# EasyEDA Pro project ProPrj_CSDR_2026-11-13.epro, schematic Schematic1, sheets 11 to 14 of 14

## Sheets
11 GPS: Create Date: 2026-10-03; Page Name: P1; Update Date: 2026-10-03
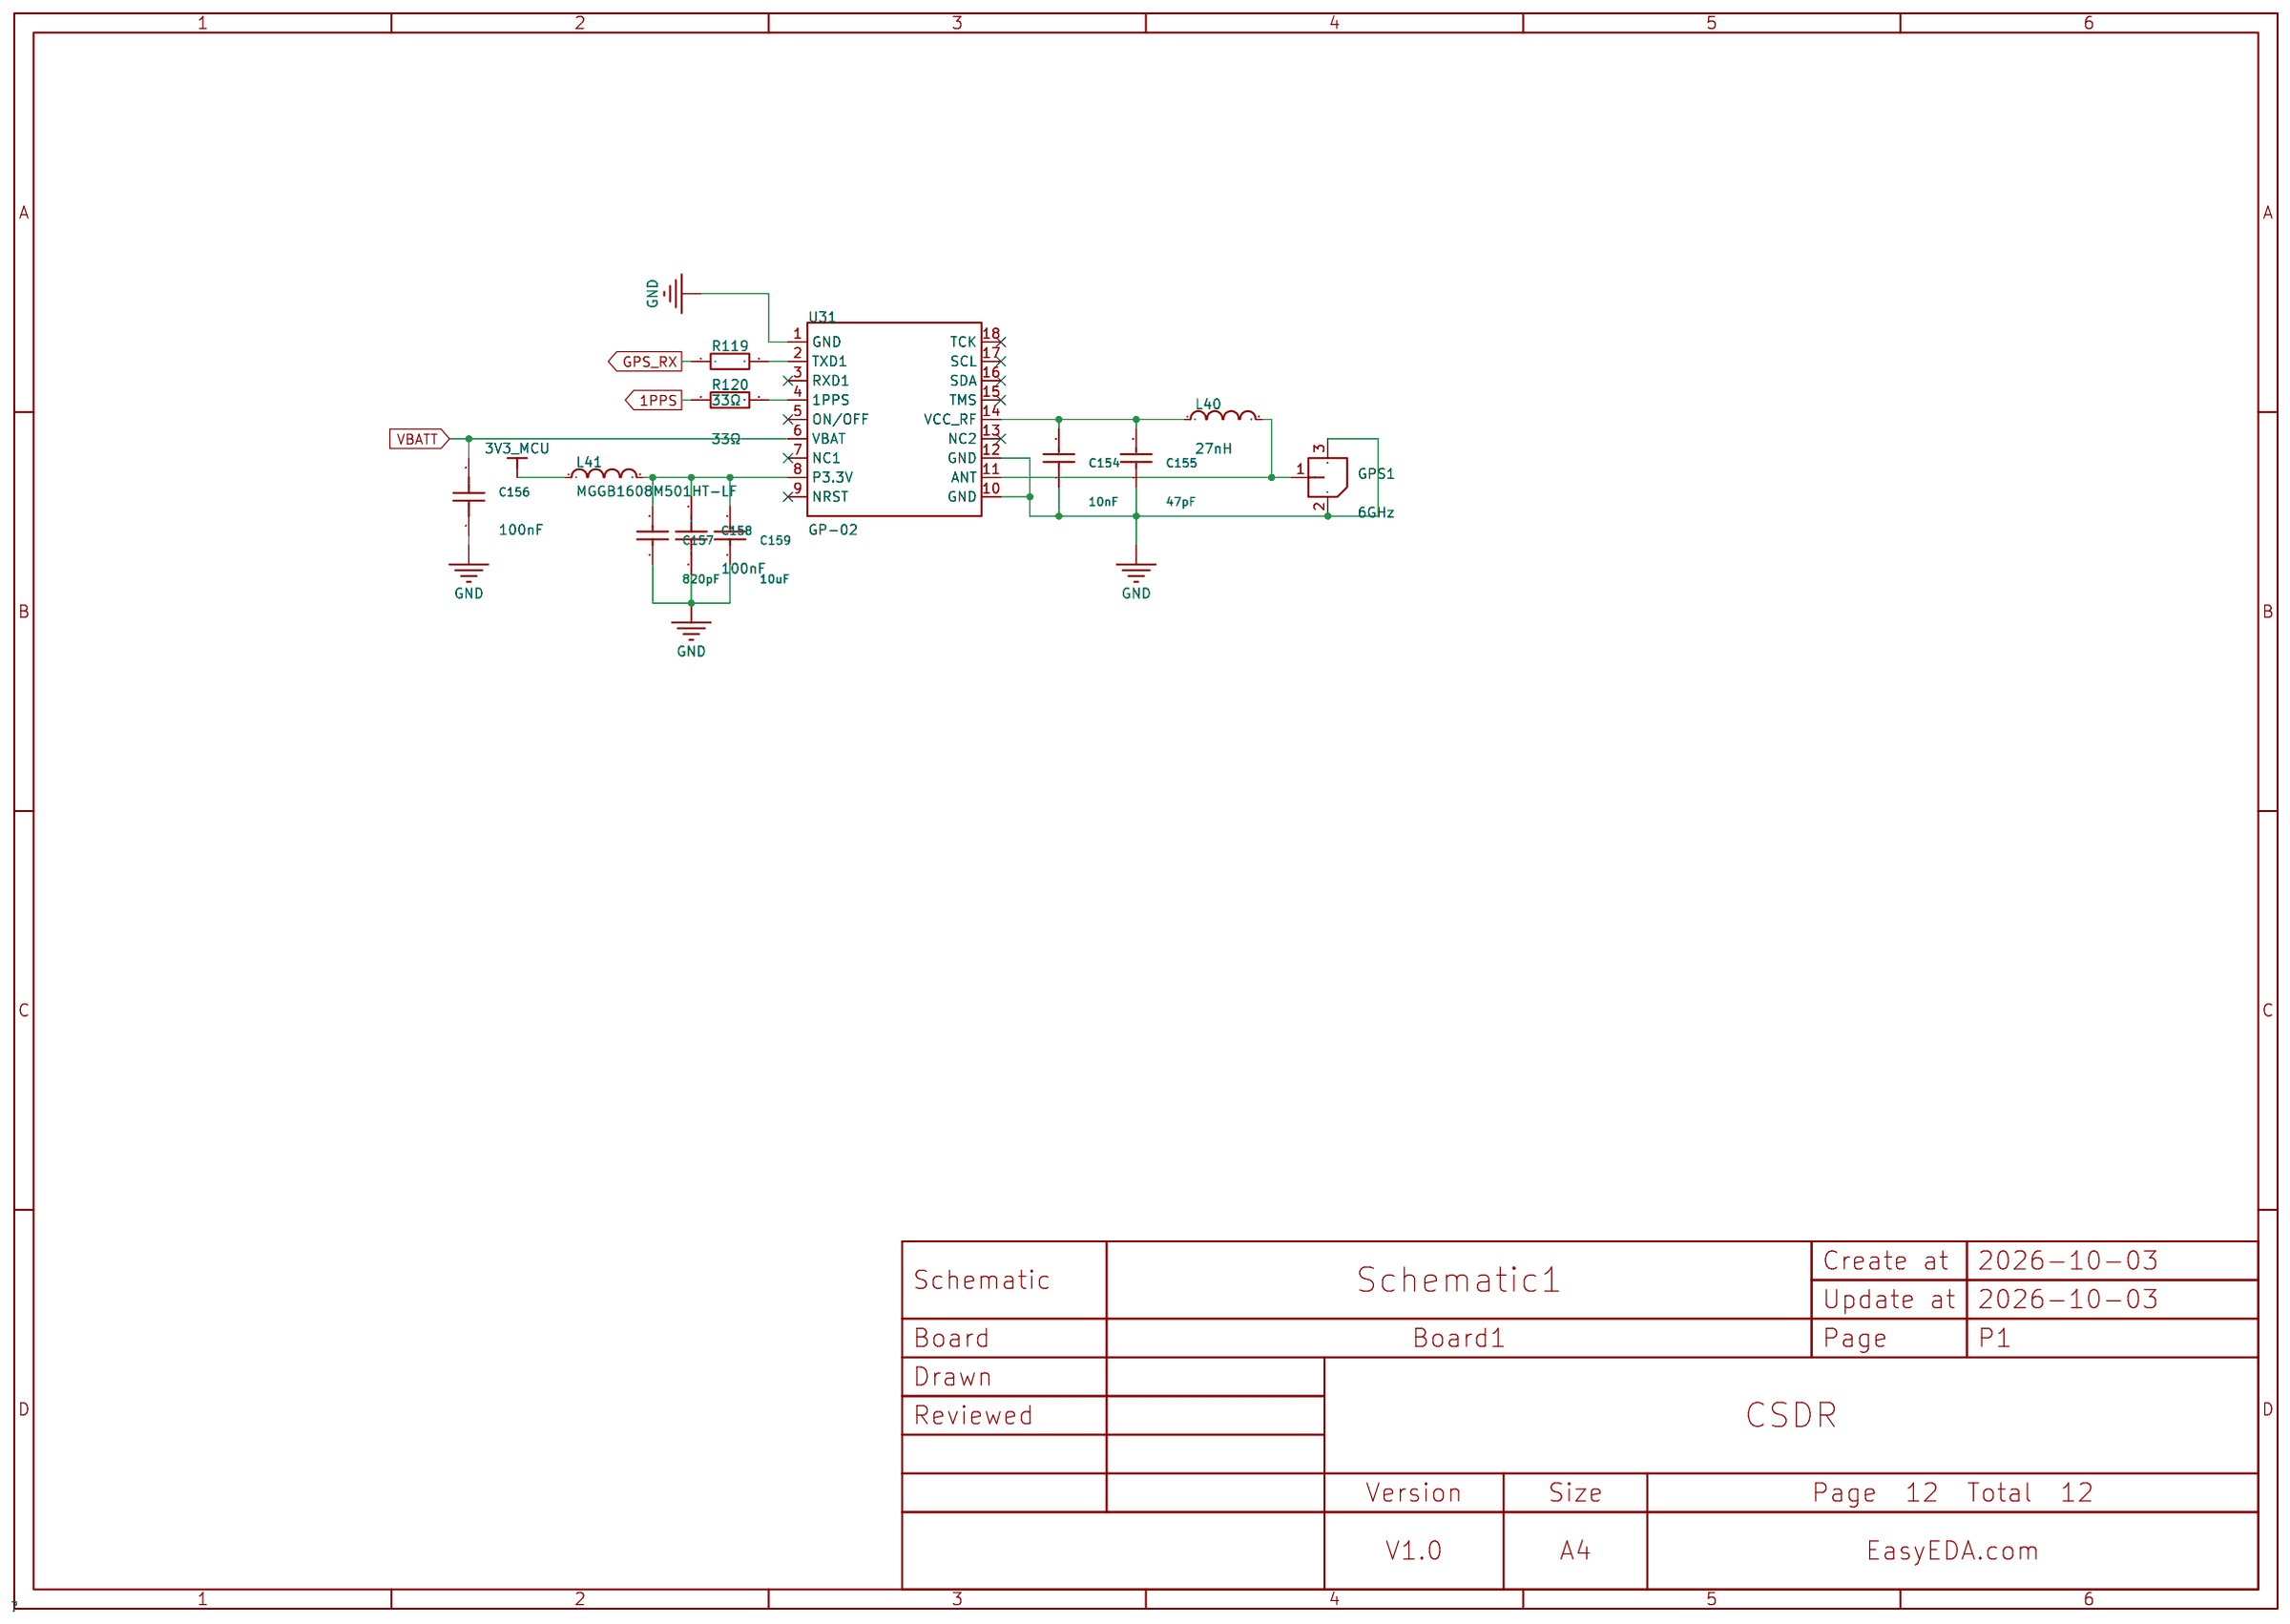
[diagram p12: GPS]
12 POWER: Create Date: 2026-10-03; Page Name: P1; Update Date: 2026-10-03
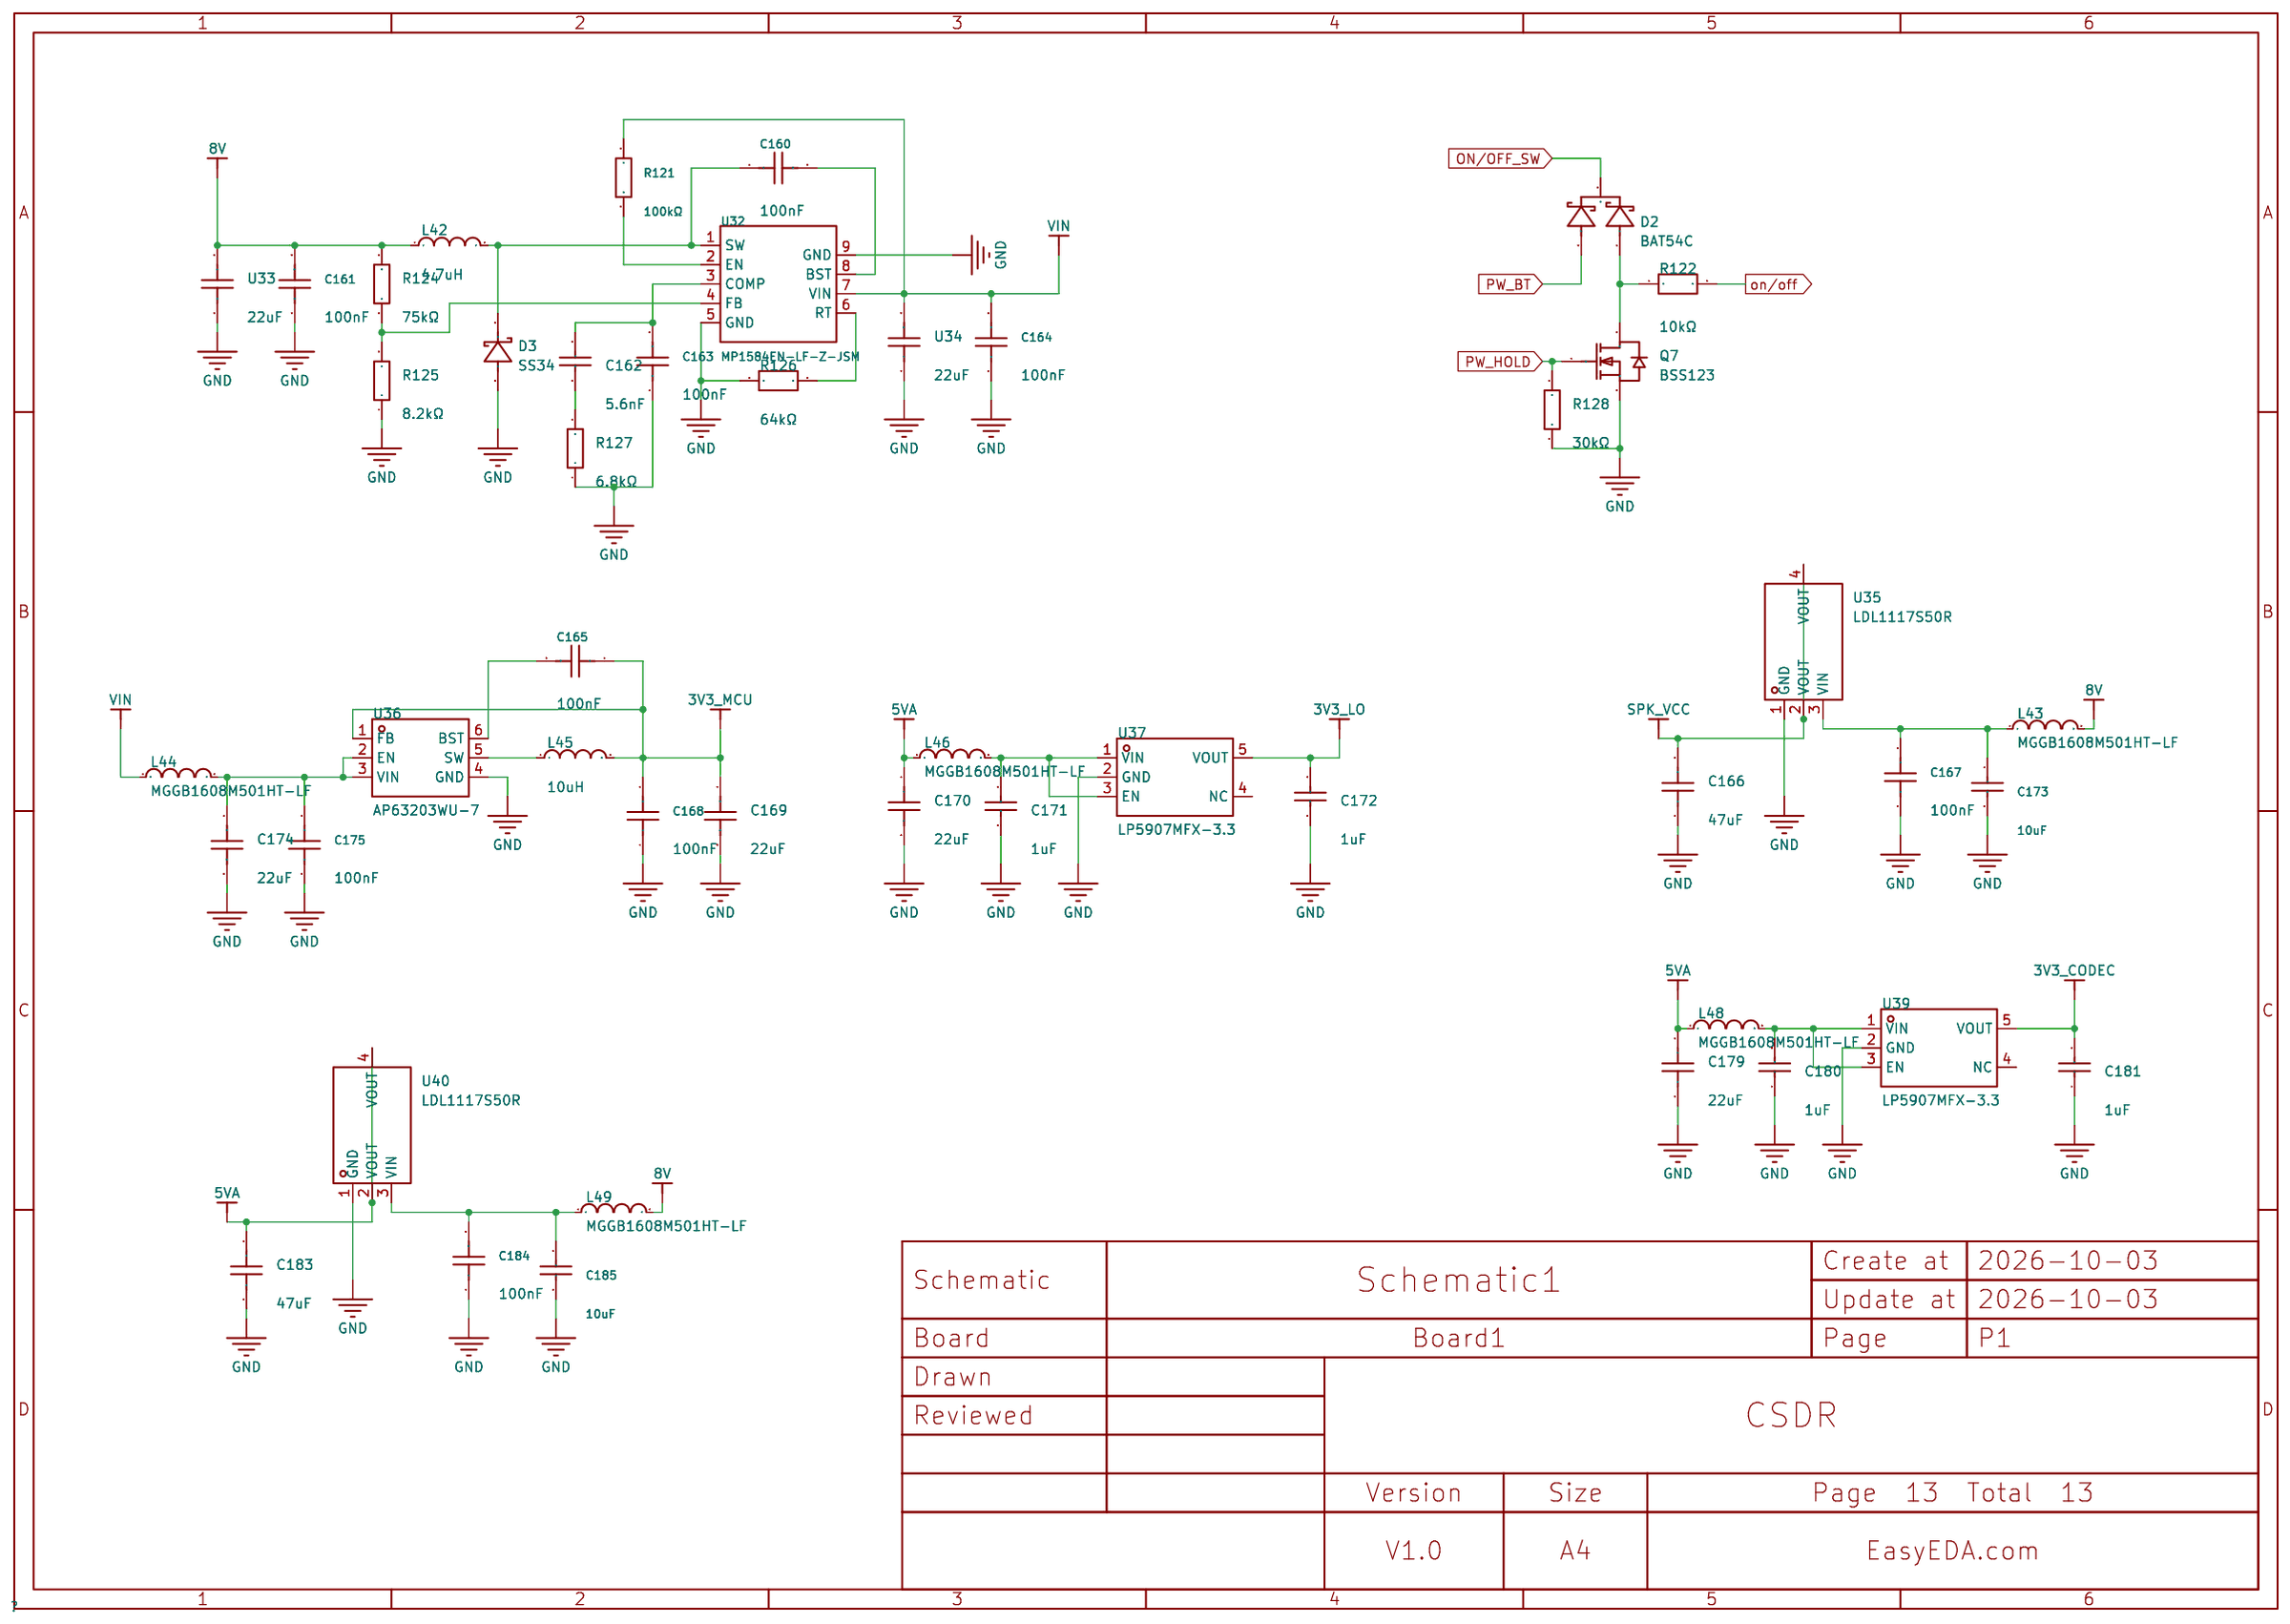
[diagram p13: POWER]
13 CONNECTOR: Create Date: 2026-10-05; Page Name: P1; Update Date: 2026-10-05
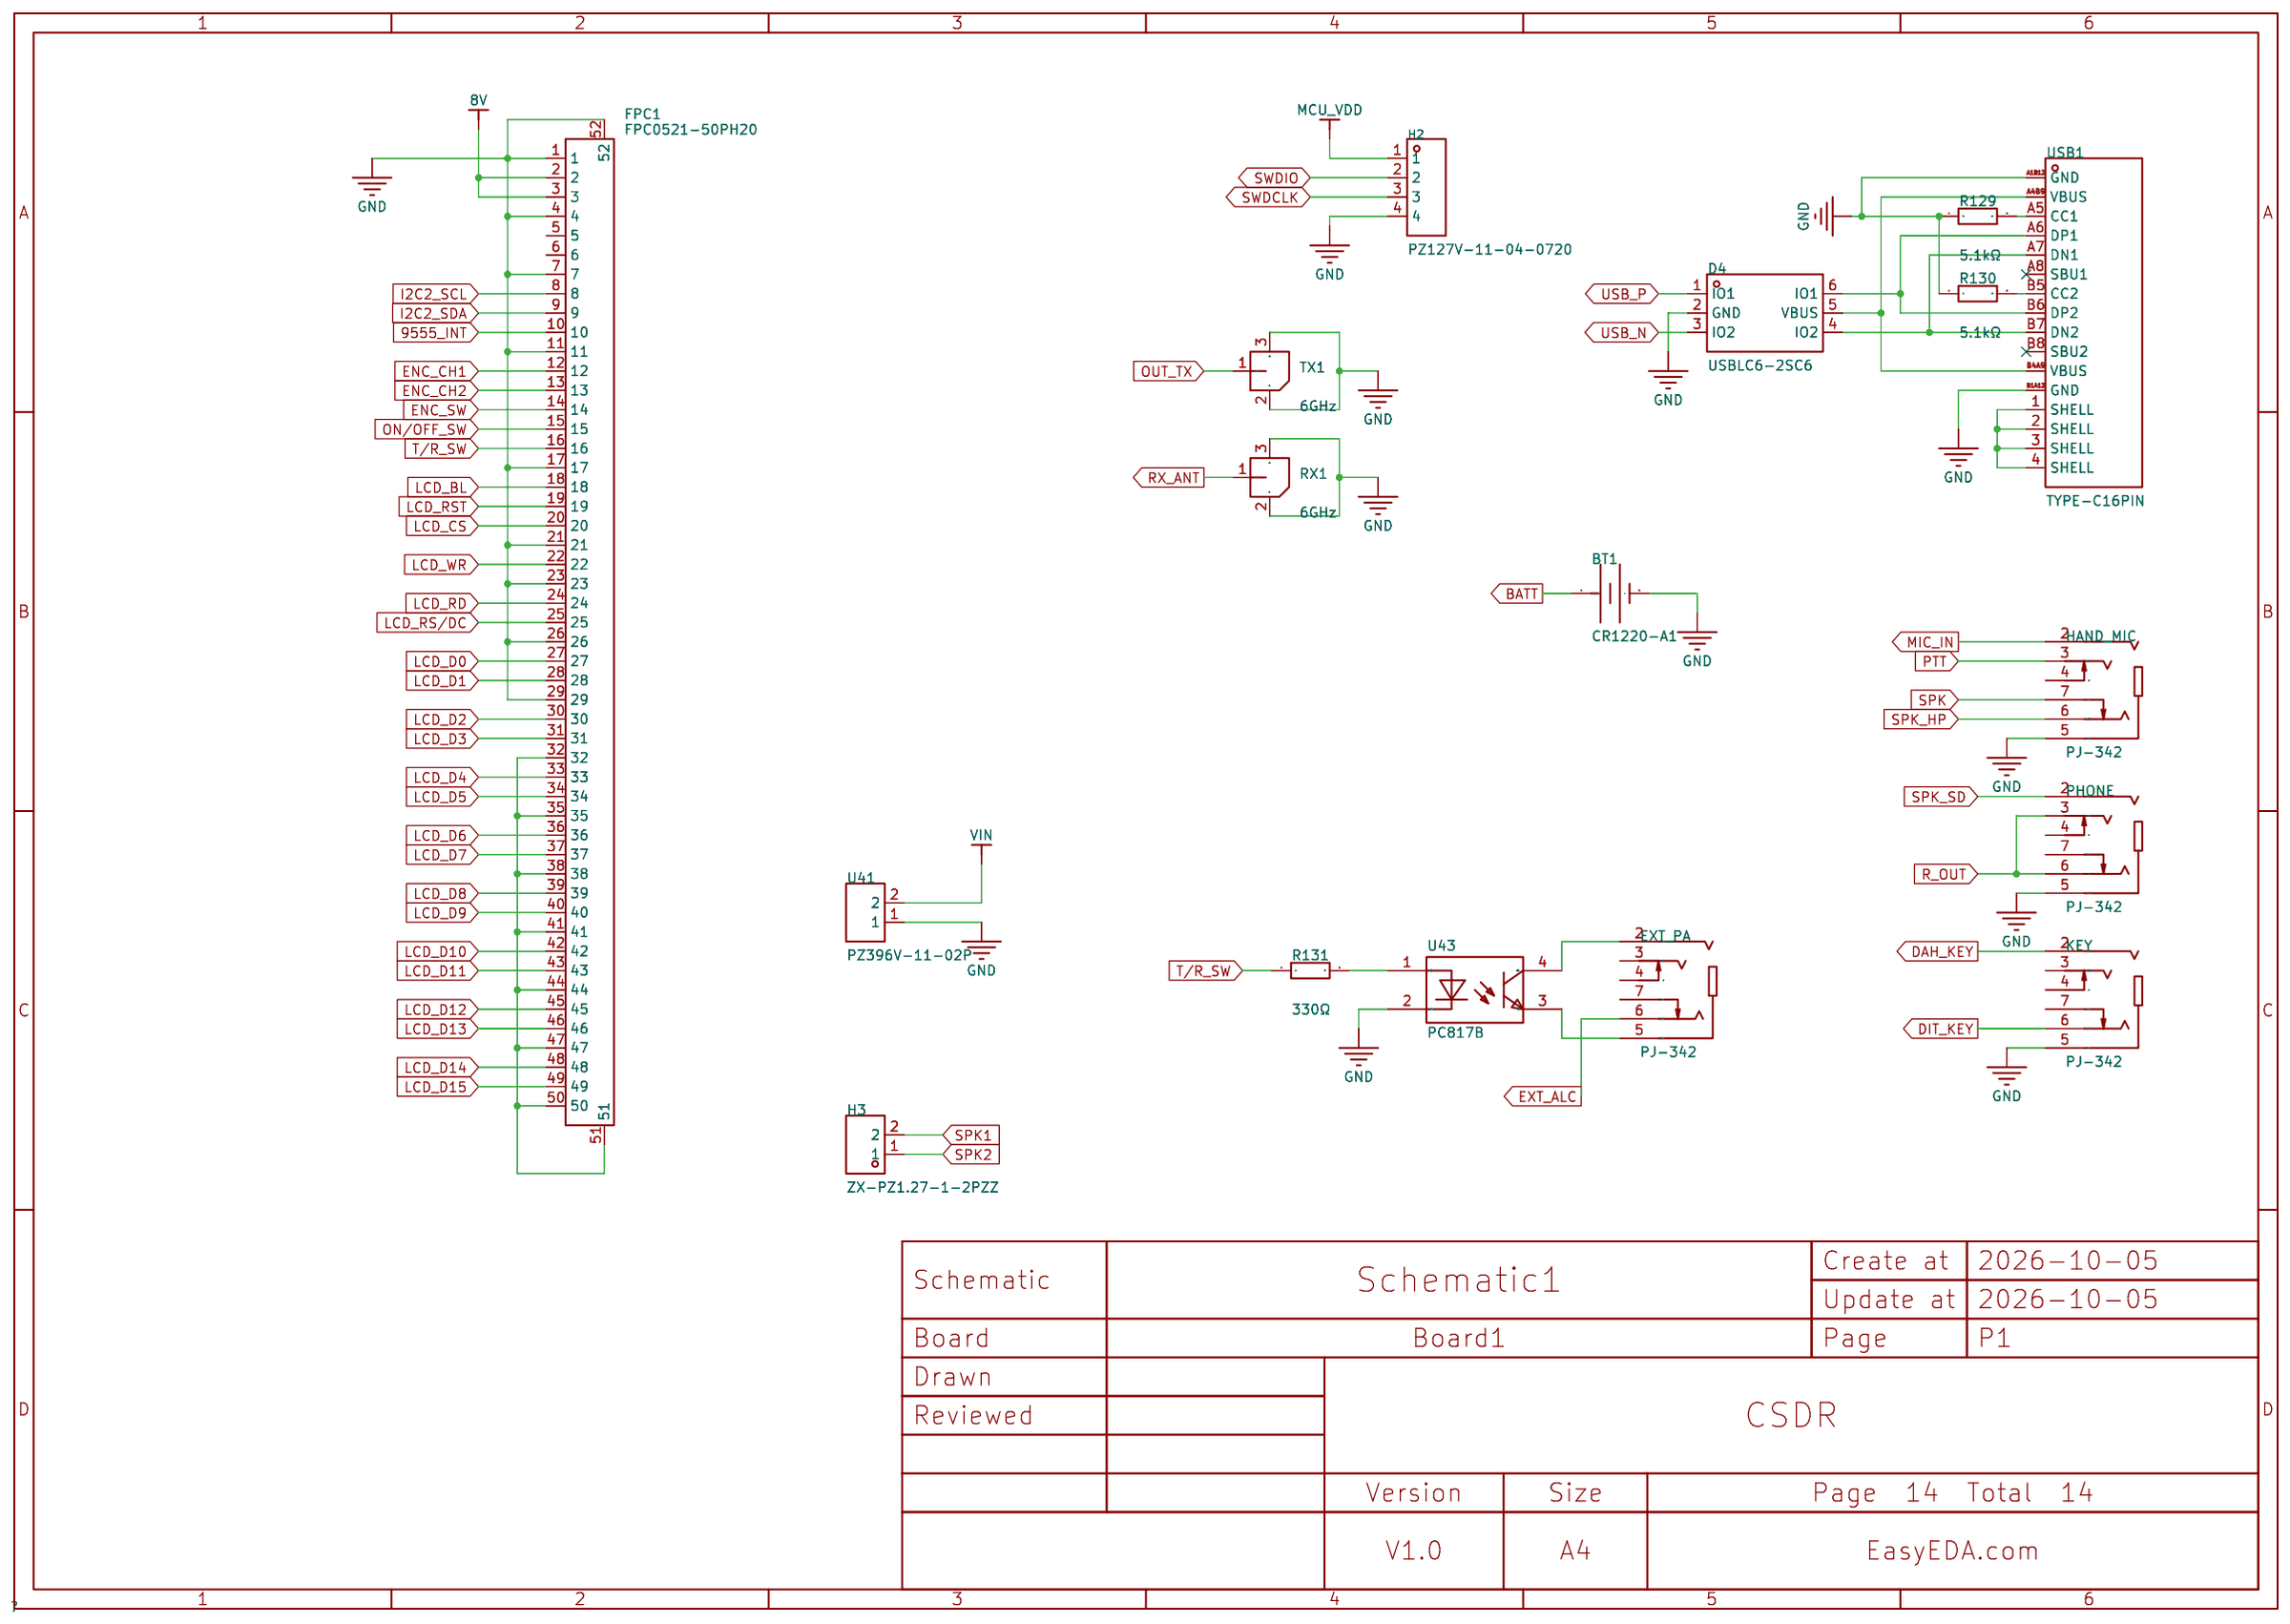
[diagram p14: CONNECTOR]
14 EXT_ALC: Create Date: 2026-11-13; Page Name: P1; Update Date: 2026-11-13
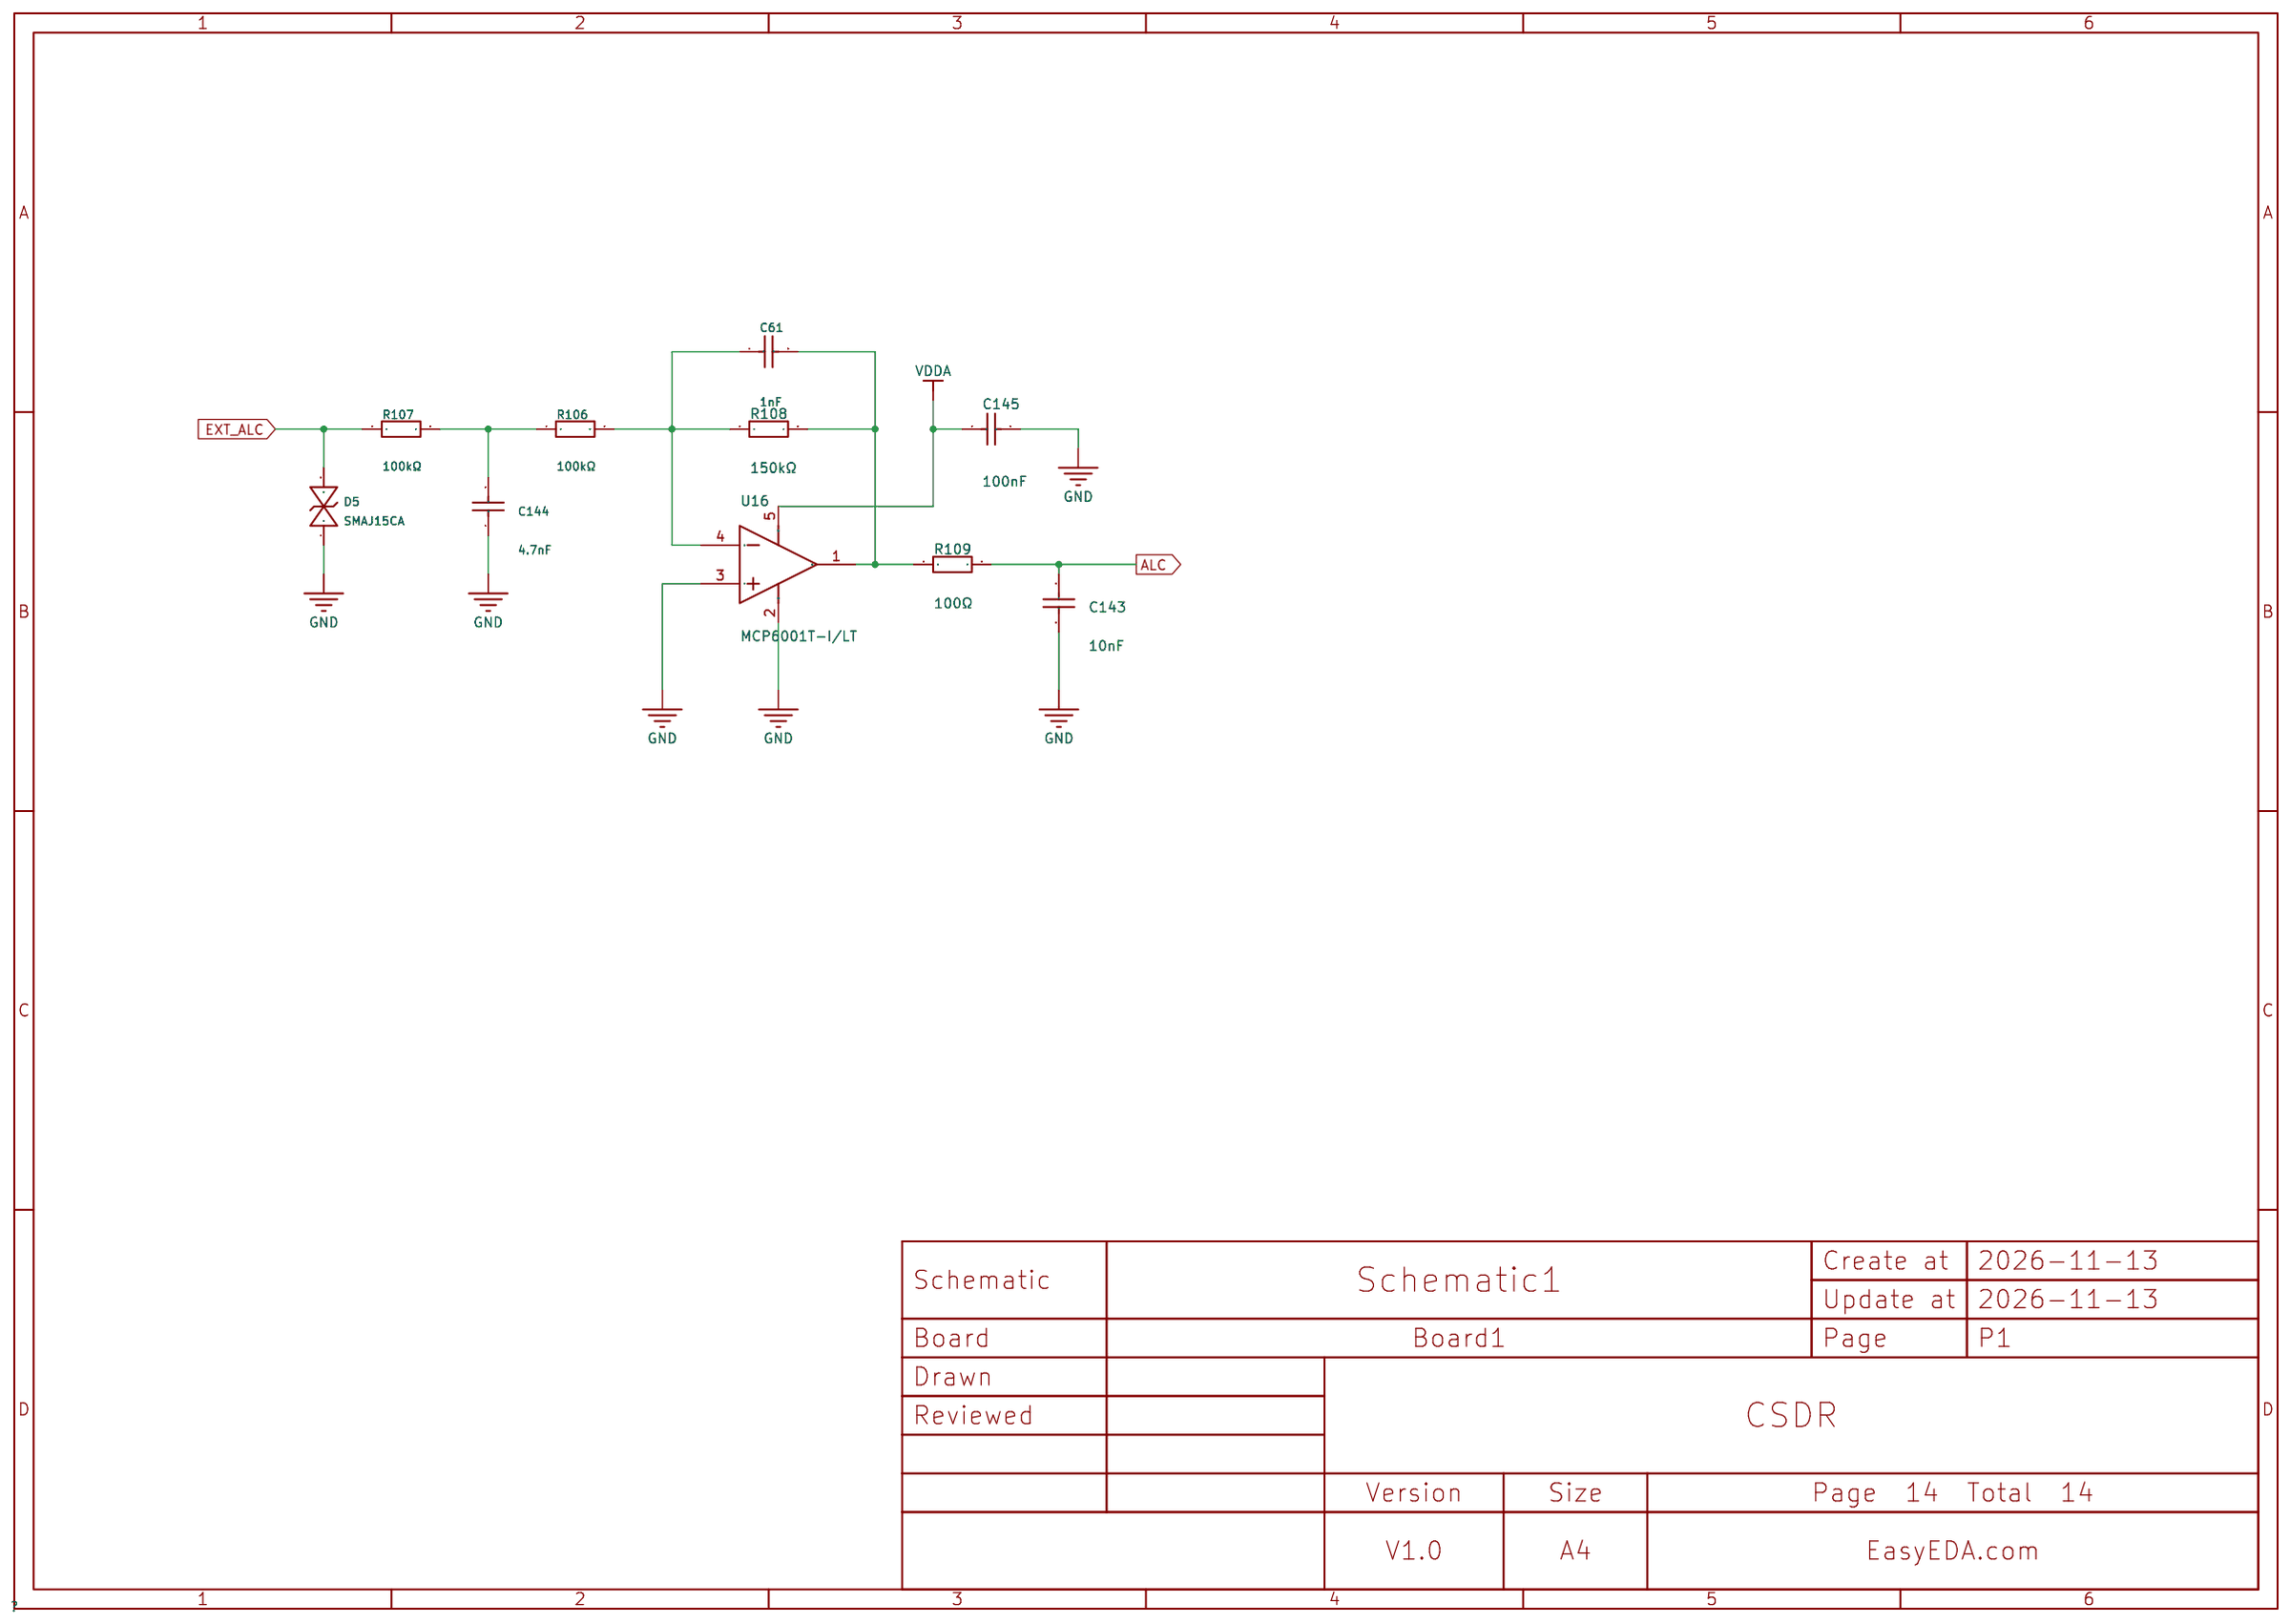
[diagram p15: EXT_ALC]

## Parts
sheet CONNECTOR
BT1  CR1220-A1  [BAT-SMD_CR1220-2]
D4  USBLC6-2SC6  [SOT-23-6_L2.9-W1.6-P0.95-LS2.8-BL]
EXT_PA  PJ-342  [AUDIO-SMD_PJ-342_C668606]
FPC1  FPC0521-50PH20  [FPC-SMD_FPC0521-50PH20]
H2  PZ127V-11-04-0720  [HDR-TH_4P-P1.27-V-M]
H3  ZX-PZ1.27-1-2PZZ  [HDR-TH_2P-P1.27-V-M-2]
HAND_MIC  PJ-342  [AUDIO-SMD_PJ-342_C668606]
KEY  PJ-342  [AUDIO-SMD_PJ-342_C668606]
PHONE  PJ-342  [AUDIO-SMD_PJ-342_C668606]
R129  5.1kΩ  [R0603]
R130  5.1kΩ  [R0603]
R131  330Ω  [R0603]
RX1  6GHz  [IPEX-SMD_3P-L2.6-W2.6-LS3.0_RF1200001R]
TX1  6GHz  [IPEX-SMD_3P-L2.6-W2.6-LS3.0_RF1200001R]
U41  PZ396V-11-02P  [HDR-TH_2P-P3.96-V-M]
U43  PC817B  [SMD-4_L6.5-W4.6-P2.54-LS10.3-TL]
USB1  TYPE-C16PIN  [USB-C-SMD_TYPE-C16PIN]
sheet EXT_ALC
C61  1nF  [C0603]
C143  10nF  [C0603]
C144  4.7nF  [C0603]
C145  100nF  [C0603]
D5  SMAJ15CA  [SMA_L4.3-W2.6-LS5.1-BI]
R106  100kΩ  [R0603]
R107  100kΩ  [R0603]
R108  150kΩ  [R0603]
R109  100Ω  [R0603]
U16  MCP6001T-I/LT  [SC-70-5_L2.1-W1.3-P0.65-LS2.1-BR]
sheet GPS
C154  10nF  [C0603]
C155  47pF  [C0603]
C156  100nF  [C0603]
C157  820pF  [C0603]
C158  100nF  [C0603]
C159  10uF  [C0603]
GPS1  6GHz  [IPEX-SMD_3P-L2.6-W2.6-LS3.0_RF1200001R]
L40  27nH  [L0603]
L41  MGGB1608M501HT-LF  [L0603]
R119  33Ω  [R0603]
R120  33Ω  [R0603]
U31  GP-02  [GPS-SMD_GP-02]
sheet POWER
C160  100nF  [C0603]
C161  100nF  [C0603]
C162  5.6nF  [C0603]
C163  100nF  [C0603]
C164  100nF  [C0603]
C165  100nF  [C0603]
C166  47uF  [C0603]
C167  100nF  [C0603]
C168  100nF  [C0603]
C169  22uF  [C0603]
C170  22uF  [C0603]
C171  1uF  [C0603]
C172  1uF  [C0603]
C173  10uF  [C0603]
C174  22uF  [C0603]
C175  100nF  [C0603]
C179  22uF  [C0603]
C180  1uF  [C0603]
C181  1uF  [C0603]
C183  47uF  [C0603]
C184  100nF  [C0603]
C185  10uF  [C0603]
D2  BAT54C  [SOT-23-3_L2.9-W1.3-P1.90-LS2.4-BR]
D3  SS34  [SMA_L4.3-W2.6-LS5.1-RD]
L42  4.7uH  [IND-SMD_L5.2-W5.2_YSPI0530]
L43  MGGB1608M501HT-LF  [L0603]
L44  MGGB1608M501HT-LF  [L0603]
L45  10uH  [IND-SMD_L4.0-W4.0_SNR4030]
L46  MGGB1608M501HT-LF  [L0603]
L48  MGGB1608M501HT-LF  [L0603]
L49  MGGB1608M501HT-LF  [L0603]
Q7  BSS123  [SOT-23-3_L2.9-W1.3-P1.90-LS2.4-BR]
R121  100kΩ  [R0603]
R122  10kΩ  [R0603]
R124  75kΩ  [R0603]
R125  8.2kΩ  [R0603]
R126  64kΩ  [R0603]
R127  6.8kΩ  [R0603]
R128  30kΩ  [R0603]
U32  MP1584EN-LF-Z-JSM  [ESOP-8_L4.9-W3.9-P1.27-LS6.0-BL-EP-2]
U33  22uF  [C0603]
U34  22uF  [C0603]
U35  LDL1117S50R  [SOT-223-3_L6.5-W3.4-P2.30-LS7.0-BR]
U36  AP63203WU-7  [TSOT-26_L2.9-W1.6-P0.95-LS2.8-BL]
U37  LP5907MFX-3.3  [SOT-23-5_L3.0-W1.7-P0.95-LS2.8-BR]
U39  LP5907MFX-3.3  [SOT-23-5_L3.0-W1.7-P0.95-LS2.8-BR]
U40  LDL1117S50R  [SOT-223-3_L6.5-W3.4-P2.30-LS7.0-BR]

## Library data of the parts
BT1 = CR1220-A1: Supplier Part: C48601334; Manufacturer: HanElectricity(瀚源); Supplier Footprint: SMD; JLCPCB Part Class: Extended Part; Datasheet: https://item.szlcsc.com/datasheet/CR1220-A1/50871511.html; Supplier: LCSC
D4 = USBLC6-2SC6_C2827654: Polarity:Unidirectional Reverse Stand-Off Voltage (Vrwm):5V Clamping Voltage:12V Peak Pulse Current (Ipp):6A Peak Pulse Power Dissipation (Ppp):150W Voltage - Breakdown:6V Reverse Leakage Current (Ir):80nA Number of Channels:2 Operating Temperature:-55℃~+; LCSC Part Name: 单向ESD 5V截止 峰值脉冲电流：6A; Supplier Part: C2827654; Manufacturer: TECH PUBLIC(台舟); Supplier Footprint: SOT-23-6; JLCPCB Part Class: Extended Part; Datasheet: https://item.szlcsc.com/datasheet/USBLC6-2SC6/2973336.html; Supplier: LCSC; Polarity: Unidirectional; Reverse Stand-Off Voltage (Vrwm): 5V; Clamping Voltage: 12V; Peak Pulse Current (Ipp): 6A; Peak Pulse Power Dissipation (Ppp): 150W; Voltage - Breakdown: 6V; Reverse Leakage Current (Ir): 80nA; Number of Channels: 2; Operating Temperature: -55℃~+125℃; level of protection: IEC 61000-4-2；IEC 61000-4-4；IEC 61000-4-5; Type: ESD; Junction Capacitance: 0.35pF
EXT_PA HAND_MIC KEY PHONE = PJ-342_C668606: Connector Type:3.5mm Headphone Jack Current Rating:500mA Voltage Rating (Max):30V Contact Material:Copper Contact Plating:Gold Operating Temperature:-30℃~+70℃ Operating Temperature:-30℃~+70℃ Rank Number:TRRS Mounting Style:Surface Mount Color:Black Body H; LCSC Part Name: 3.5mm耳机座; Supplier Part: C668606; Manufacturer: SHOU HAN(首韩); Supplier Footprint: SMD; JLCPCB Part Class: Extended Part; Datasheet: https://item.szlcsc.com/datasheet/PJ-342/698549.html; Supplier: LCSC; Connector Type: 3.5mm Headphone Jack; Current Rating: 500mA; Voltage Rating (Max): 30V; Contact Material: Copper; Contact Plating: Gold; Operating Temperature: -30℃~+70℃; Rank Number: TRRS; Mounting Style: Surface Mount; Color: Black; Body Height: 4.5mm; Length: 14mm; Width: 6.4mm
FPC1 = FPC0521-50PH20: Locking Feature:Hinged Lid Contact Type:Bottom Contact Number of Contacts:50P Pitch:0.5mm Mounting Type:Surface Mount, Right Angle FFC, FCB Thickness:0.3mm FFC, FCB Thickness:0.3mm Height Above Board:2mm Contact Material:Phosphor bronze Contact Plating:Ti; LCSC Part Name: 翻盖式 下接 P数:50P 间距:0.5mm; Supplier Part: C54934670; Manufacturer: XUNPU(讯普); Supplier Footprint: SMD,P=0.5mm,卧贴; JLCPCB Part Class: Extended Part; Datasheet: https://item.szlcsc.com/datasheet/FPC0521-50PH20/58488132.html; Supplier: LCSC; Locking Feature: Hinged Lid; Contact Type: Bottom Contact; Number of Contacts: 50P; Pitch: 0.5mm; Mounting Type: Surface Mount, Right Angle; FFC, FCB Thickness: 0.3mm; Height Above Board: 2mm; Contact Material: Phosphor bronze; Contact Plating: Tin; Operating Temperature: -40℃~+85℃; Rated Voltage (Max): 50V; Current Rating (Max): 500mA
H2 = PZ127V-11-04-0720: Pin Structure:1x4P Pitch:1.27mm Row Spacing:- Circluar Pins/Square Pins:Pin Header Mounting Type:Through Hole Number of Rows:1 Number of Pins:4P Current Rating:1A Voltage Rating (Max):- Length of Mating Pin:3.9mm Insulation Height:1mm Length of End Connec; LCSC Part Name: 1x4P 间距:1.27mm 方针 直插; Supplier Part: C541879; Manufacturer: XFCN(兴飞); Supplier Footprint: 插件,P=1.27mm; JLCPCB Part Class: Extended Part; Datasheet: https://item.szlcsc.com/datasheet/PZ127V-11-04-0720/562500.html; Supplier: LCSC; Pin Structure: 1x4P; Pitch: 1.27mm; Circluar Pins/Square Pins: Pin Header; Mounting Type: Through Hole; Number of Rows: 1; Number of Pins: 4P; Current Rating: 1A; Length of Mating Pin: 3.9mm; Insulation Height: 1mm; Length of End Connection Pin: 2.3mm; Contact Material: Brass; Operating Temperature: -40℃~+105℃; Color: Black
H3 = ZX-PZ1.27-1-2PZZ: Pin Structure:1x2P Pitch:1.27mm Row Spacing:- Circluar Pins/Square Pins:Pin Header Mounting Type:Through Hole Number of Rows:1 Number of Pins:2P Current Rating:1A Voltage Rating (Max):- Length of Mating Pin:3.9mm Insulation Height:1mm Length of End Connec; LCSC Part Name: 1x2P 间距:1.27mm 方针 直插; Supplier Part: C41370734; Manufacturer: Megastar(兆星); Supplier Footprint: 插件,P=1.27mm; JLCPCB Part Class: Extended Part; Datasheet: https://item.szlcsc.com/datasheet/ZX-PZ1.27-1-2PZZ/43131037.html; Supplier: LCSC; Pin Structure: 1x2P; Pitch: 1.27mm; Circluar Pins/Square Pins: Pin Header; Mounting Type: Through Hole; Number of Rows: 1; Number of Pins: 2P; Current Rating: 1A; Length of Mating Pin: 3.9mm; Insulation Height: 1mm; Length of End Connection Pin: 2.3mm; Contact Material: Brass; Contact Plating: Gold; Operating Temperature: -40℃~+105℃; Color: Black
R129 R130 = RC0603FR-075K1L: Type:Thick Film Resistors Resistance:5.1kΩ Tolerance:±1% Tolerance:±1% Power(Watts):100mW Voltage-Supply(Max):75V Temperature Coefficient:±100ppm/℃ Temperature Coefficient:±100ppm/℃ Operating Temperature:-55℃~+155℃ Operating Temperature:-55℃~+155℃; LCSC Part Name: 厚膜电阻 5.1kΩ ±1% 100mW; Supplier Part: C105580; Manufacturer: YAGEO(国巨); Supplier Footprint: 0603; JLCPCB Part Class: Extended Part; Datasheet: https://item.szlcsc.com/datasheet/RC0603FR-075K1L/106795.html; Supplier: LCSC; Type: Thick Film Resistors; Tolerance: ±1%; Power(Watts): 100mW; Voltage-Supply(Max): 75V; Temperature Coefficient: ±100ppm/℃; Operating Temperature: -55℃~+155℃
R131 = RC0603FR-07330RL: Type:Thick Film Resistors Resistance: Tolerance:±1% Tolerance:±1% Power(Watts): Overload Voltage (Max): Temperature Coefficient:±100ppm/℃ Temperature Coefficient:±100ppm/℃ Operating Temperature Range:-55℃~+155℃ Operating Temperature Range:-55℃~+155℃; LCSC Part Name: 厚膜电阻 330Ω ±1% 100mW; Supplier Part: C105881; Manufacturer: YAGEO(国巨); Supplier Footprint: 0603; JLCPCB Part Class: Extended Part; Datasheet: https://atta.szlcsc.com/upload/public/pdf/source/20180821/C275644_0D56F95EFF785E7D9A1FEF436B37DA78.pdf; Supplier: LCSC; Type: Thick Film Resistors; Tolerance: ±1%; Temperature Coefficient: ±100ppm/℃; Operating Temperature Range: -55℃~+155℃
GPS1 RX1 TX1 = IPEX-1_C47986640: Connector Type:Board Side Interface:Inner pin Number of Ports:1 Interface Diameter:2mm Interface Length/Height:1.25mm Frequency:6GHz RF Series:IPEX Impedance:50Ω Rated Voltage (Max):60V Operating Temperature Range:-40℃~+85℃ Operating Temperature Range:-40; LCSC Part Name: 内针 IPEX; Supplier Part: C47986640; Manufacturer: HanElectricity(瀚源); Manufacturer Part: IPEX-1; Supplier Footprint: SMD; JLCPCB Part Class: Extended Part; Datasheet: https://item.szlcsc.com/datasheet/IPEX-1/50223057.html; Supplier: LCSC; Connector Type: Board Side; Interface: Inner pin; Number of Ports: 1; Interface Diameter: 2mm; Interface Length/Height: 1.25mm; RF Series: IPEX; Impedance: 50Ω; Rated Voltage (Max): 60V; Operating Temperature Range: -40℃~+85℃
U41 = PZ396V-11-02P: Pin Structure:1x2P Pitch:3.96mm Circluar Pins/Square Pins:Square pin Mounting Type:Through Hole Number of Rows:1 Number of Pins:2P Current Rating:7A Length of Mating Pin:8mm Insulation Height:3.2mm Length of End Connection Pin:3.5mm Contact Material:Brass; LCSC Part Name: 1x2P 间距:3.96mm 方针 直插; Supplier Part: C41355705; Manufacturer: XFCN(兴飞); Supplier Footprint: 插件,P=3.96mm; JLCPCB Part Class: Extended Part; Datasheet: https://item.szlcsc.com/datasheet/PZ396V-11-02P/43092891.html; Supplier: LCSC; Pin Structure: 1x2P; Pitch: 3.96mm; Circluar Pins/Square Pins: Square pin; Mounting Type: Through Hole; Number of Rows: 1; Number of Pins: 2P; Current Rating: 7A; Length of Mating Pin: 8mm; Insulation Height: 3.2mm; Length of End Connection Pin: 3.5mm; Contact Material: Brass; Operating Temperature: -40℃~+105℃; Color: Black
U43 = PC817B_C5451664: Input type:DC Output Type:Phototransistor Voltage - Forward(Vf):1.2V Output Current:50mA Isolation Voltage(Vrms):5kV Reverse Voltage:6V Load Voltage:35V Number of Outputs:1 Vce Saturation(VCE(sat)):200mV Rise time:18us Fall time:5us Operating Temperature:; LCSC Part Name: B档 输入电压类型: DC 输出电流: 50mA; Supplier Part: C5451664; Manufacturer: HXY MOSFET(华轩阳电子); Supplier Footprint: SMD-4P; JLCPCB Part Class: Extended Part; Datasheet: https://item.szlcsc.com/datasheet/PC817B/6355407.html; Supplier: LCSC; Input type: DC; Output Type: Phototransistor; Voltage - Forward(Vf): 1.2V; Output Current: 50mA; Isolation Voltage(Vrms): 5kV; Reverse Voltage: 6V; Load Voltage: 35V; Number of Outputs: 1; Vce Saturation(VCE(sat)): 200mV; Rise time: 18us; Fall time: 5us; Operating Temperature: -55℃~+110℃; Current Transfer Ratio (CTR) Minimum: 130%; Current Transfer Ratio (CTR) Maximum/Saturation Value: 260%; Forward Current(If): 50mA
USB1 = TYPE-C16PIN: Connector Type:Type-C Protocol Standard:- Gender:Female Mounting Type:Surface Mount, Right Angle Number of Contacts:16P Number of Ports:1 Current Rating-Power:3A Voltage Rating:5V Connect-Disconnect Life:10 thousand cycles Supplementary Features:- Center; LCSC Part Name: Type-C 母 卧贴; Supplier Part: C393939; Manufacturer: SHOU HAN(首韩); Supplier Footprint: SMD; JLCPCB Part Class: Extended Part; Datasheet: https://item.szlcsc.com/datasheet/TYPE-C16PIN/372551.html; Supplier: LCSC; Connector Type: Type-C; Gender: Female; Mounting Type: Surface Mount, Right Angle; Number of Contacts: 16P; Number of Ports: 1; Current Rating-Power: 3A; Voltage Rating: 5V; Connect-Disconnect Life: 10 thousand cycles; Length: 7.35mm; Detection color: Black; Operating Temperature: -25℃~+85℃
C61 = CC0603KRX7R9BB102: Capacitance: Tolerance:±10% Tolerance:±10% Voltage Rated: Temperature Coefficient:; LCSC Part Name: 1nF ±10% 50V; Supplier Part: C100040; Manufacturer: YAGEO(国巨); Supplier Footprint: 0603; JLCPCB Part Class: Extended Part; Datasheet: https://atta.szlcsc.com/upload/public/pdf/source/20180910/C282072_33301C7F631E79921B82A8DAC6BCC5B3.pdf; Supplier: LCSC; Tolerance: ±10%
C143 = CL10B103KB8NNNC: Capacitance:10nF Tolerance:±10% Tolerance:±10% Voltage Rating:50V Temperature Coefficient:X7R; LCSC Part Name: 10nF ±10% 50V; Supplier Part: C1589; Manufacturer: SAMSUNG(三星); Supplier Footprint: 0603; JLCPCB Part Class: Extended Part; Datasheet: https://item.szlcsc.com/datasheet/CL10B103KB8NNNC/1941.html; Supplier: LCSC; Tolerance: ±10%; Voltage Rating: 50V; Temperature Coefficient: X7R
C144 = CC0603KRX7R9BB472: Capacitance:4.7nF Tolerance:±10% Tolerance:±10% Voltage Rating:50V Temperature Coefficient:X7R; LCSC Part Name: 4.7nF ±10% 50V; Supplier Part: C106218; Manufacturer: YAGEO(国巨); Supplier Footprint: 0603; JLCPCB Part Class: Extended Part; Datasheet: https://item.szlcsc.com/datasheet/CC0603KRX7R9BB472/107433.html; Supplier: LCSC; Tolerance: ±10%; Voltage Rating: 50V; Temperature Coefficient: X7R
C145 = CC0603JRX7R9BB104: Capacitance: Tolerance:±5% Tolerance:±5% Voltage Rated: Temperature Coefficient:; LCSC Part Name: 100nF ±5% 50V; Supplier Part: C91183; Manufacturer: YAGEO(国巨); Supplier Footprint: 0603; JLCPCB Part Class: Extended Part; Datasheet: https://atta.szlcsc.com/upload/public/pdf/source/20170919/C131031_1505787245477976978.pdf; Supplier: LCSC; Tolerance: ±5%
D5 = SMAJ15CA_C46956337: Polarity:Bidirectional Reverse Stand-Off Voltage (Vrwm):15V Clamping Voltage:24.4V Peak Pulse Current (Ipp):16.4A Peak Pulse Power Dissipation (Ppp):400W@10/1000us Voltage - Breakdown:18.5V Reverse Leakage Current (Ir):1uA Number of Channels:1 Operating T; LCSC Part Name: 双向TVS 15V截止 峰值浪涌电流：16.4A; Supplier Part: C46956337; Manufacturer: TDSEMIC(拓电半导体); Supplier Footprint: SMA; JLCPCB Part Class: Extended Part; Datasheet: https://item.szlcsc.com/datasheet/SMAJ15CA/49125022.html; Supplier: LCSC; Polarity: Bidirectional; Reverse Stand-Off Voltage (Vrwm): 15V; Clamping Voltage: 24.4V; Peak Pulse Current (Ipp): 16.4A; Peak Pulse Power Dissipation (Ppp): 400W@10/1000us; Voltage - Breakdown: 18.5V; Reverse Leakage Current (Ir): 1uA; Number of Channels: 1; Operating Temperature: -55℃~+150℃; Type: TVS
R106 R107 R121 = RC0603FR-07100KL: Type:Thick Film Resistor Resistance:100kΩ Tolerance:±1% Tolerance:±1% Power(Watts):100mW Voltage-Supply(Max):75V Temperature Coefficient:±100ppm/℃ Temperature Coefficient:±100ppm/℃ Operating Temperature:-55℃~+155℃ Operating Temperature:-55℃~+155℃; LCSC Part Name: 厚膜电阻 100kΩ ±1%; Supplier Part: C14675; Manufacturer: YAGEO(国巨); Supplier Footprint: 0603; JLCPCB Part Class: Extended Part; Datasheet: https://item.szlcsc.com/datasheet/RC0603FR-07100KL/15343.html; Supplier: LCSC; Type: Thick Film Resistor; Tolerance: ±1%; Power(Watts): 100mW; Voltage-Supply(Max): 75V; Temperature Coefficient: ±100ppm/℃; Operating Temperature: -55℃~+155℃
R108 = RC0603FR-07150KL: Type:Thick Film Resistors Resistance: Tolerance:±1% Tolerance:±1% Power(Watts): Overload Voltage (Max): Temperature Coefficient:±100ppm/℃ Temperature Coefficient:±100ppm/℃ Operating Temperature Range:-55℃~+155℃ Operating Temperature Range:-55℃~+155℃; LCSC Part Name: 厚膜电阻 150kΩ ±1% 100mW; Supplier Part: C114660; Manufacturer: YAGEO(国巨); Supplier Footprint: 0603; JLCPCB Part Class: Extended Part; Datasheet: https://atta.szlcsc.com/upload/public/pdf/source/20180821/C275644_0D56F95EFF785E7D9A1FEF436B37DA78.pdf; Supplier: LCSC; Type: Thick Film Resistors; Tolerance: ±1%; Temperature Coefficient: ±100ppm/℃; Operating Temperature Range: -55℃~+155℃
R109 = RC0603FR-07100RL: Type:Thick Film Resistor Resistance:100Ω Tolerance:±1% Tolerance:±1% Power(Watts):100mW Voltage-Supply(Max):75V Temperature Coefficient:±100ppm/℃ Temperature Coefficient:±100ppm/℃ Operating Temperature:-55℃~+155℃ Operating Temperature:-55℃~+155℃; LCSC Part Name: 厚膜电阻 100Ω ±1% 100mW; Supplier Part: C105588; Manufacturer: YAGEO(国巨); Supplier Footprint: 0603; JLCPCB Part Class: Extended Part; Datasheet: https://item.szlcsc.com/datasheet/RC0603FR-07100RL/106804.html; Supplier: LCSC; Type: Thick Film Resistor; Tolerance: ±1%; Power(Watts): 100mW; Voltage-Supply(Max): 75V; Temperature Coefficient: ±100ppm/℃; Operating Temperature: -55℃~+155℃
U16 = MCP6001T-I/LT: Number of Channels:1 Rail to Rail:Rail-to-Rail Input, Rail-to-Rail Output Gain Bandwidth Product:1MHz Vos - Input Offset Voltage:4.5mV Input Offset Voltage Drift(Vos TC):2uV/℃ Slew Rate:600V/ms Ib - Input Bias Current:1pA Input Offset Current(Ios):1pA Inp; LCSC Part Name: 1 MHz 低功耗运算放大器; Supplier Part: C47040; Manufacturer: MICROCHIP(美国微芯); Supplier Footprint: SC-70-5; JLCPCB Part Class: Extended Part; Datasheet: https://item.szlcsc.com/datasheet/MCP6001T-I%252FLT/48045.html; Supplier: LCSC; Number of Channels: 1; Rail to Rail: Rail-to-Rail Input, Rail-to-Rail Output; Gain Bandwidth Product: 1MHz; Vos - Input Offset Voltage: 4.5mV; Input Offset Voltage Drift(Vos TC): 2uV/℃; Slew Rate: 600V/ms; Ib - Input Bias Current: 1pA; Input Offset Current(Ios): 1pA; Input Voltage Noise Density: 28nV/√Hz@1kHz; Common Mode Rejection Ratio(CMRR): 76dB; Quiescent Current: 100uA; Output Current: 23mA; Operating Temperature: -40℃~+125℃; Single supply: 1.8V~6V
C154 = CC0603KRX7R9BB103: Capacitance:10nF Tolerance:±10% Tolerance:±10% Voltage Rating:50V Temperature Coefficient:X7R; LCSC Part Name: 10nF ±10% 50V; Supplier Part: C100042; Manufacturer: YAGEO(国巨); Supplier Footprint: 0603; JLCPCB Part Class: Extended Part; Datasheet: https://item.szlcsc.com/datasheet/CC0603KRX7R9BB103/101256.html; Supplier: LCSC; Tolerance: ±10%; Voltage Rating: 50V; Temperature Coefficient: X7R
C155 = CC0603JRNPO9BN470: Capacitance:47pF Tolerance:±5% Tolerance:±5% Voltage Rating:50V Temperature Coefficient:NP0; LCSC Part Name: 47pF ±5% 50V; Supplier Part: C105622; Manufacturer: YAGEO(国巨); Supplier Footprint: 0603; JLCPCB Part Class: Extended Part; Datasheet: https://item.szlcsc.com/datasheet/CC0603JRNPO9BN470/106837.html; Supplier: LCSC; Tolerance: ±5%; Voltage Rating: 50V; Temperature Coefficient: NP0
C156 C158 C160 C161 C163-C165 C167 C168 C175 C184 = CC0603KRX7R9BB104: Capacitance:100nF Tolerance:±10% Tolerance:±10% Voltage Rating:50V Temperature Coefficient:X7R; LCSC Part Name: 100nF ±10% 50V; Supplier Part: C14663; Manufacturer: YAGEO(国巨); Supplier Footprint: 0603; JLCPCB Part Class: Basic Part; Datasheet: https://item.szlcsc.com/datasheet/CC0603KRX7R9BB104/15331.html; Supplier: LCSC; Tolerance: ±10%; Voltage Rating: 50V; Temperature Coefficient: X7R
C157 = CC0603JRNPO9BN821: Capacitance:820pF Tolerance:±5% Tolerance:±5% Voltage Rating:50V Temperature Coefficient:NP0; LCSC Part Name: 820pF ±5% 50V; Supplier Part: C107057; Manufacturer: YAGEO(国巨); Supplier Footprint: 0603; JLCPCB Part Class: Extended Part; Datasheet: https://item.szlcsc.com/datasheet/CC0603JRNPO9BN821/108273.html; Supplier: LCSC; Tolerance: ±5%; Voltage Rating: 50V; Temperature Coefficient: NP0
C159 C173 C185 = CL10A106MO8NQNC: Capacitance:10uF Tolerance:±20% Tolerance:±20% Voltage Rating:16V Temperature Coefficient:X5R; LCSC Part Name: 10uF ±20% 16V; Supplier Part: C92487; Manufacturer: SAMSUNG(三星); Supplier Footprint: 0603; JLCPCB Part Class: Extended Part; Datasheet: https://item.szlcsc.com/datasheet/CL10A106MO8NQNC/93680.html; Supplier: LCSC; Tolerance: ±20%; Voltage Rating: 16V; Temperature Coefficient: X5R
L40 = VHF160808H27NJT: Inductance:27nH Tolerance:±5% Tolerance:±5% Current Rating:300mA Current - Saturation (Isat):- DC Resistance(DCR):650mΩ Q @ Frequency:12@100MHz Frequency - Self Resonant:1.7GHz Type:High-frequency inductor；Multilayer inductor Magnetic Core:-; LCSC Part Name: 27nH ±5%; Supplier Part: C90208; Manufacturer: FH(风华); Supplier Footprint: 0603; JLCPCB Part Class: Extended Part; Datasheet: https://item.szlcsc.com/datasheet/VHF160808H27NJT/91393.html; Supplier: LCSC; Tolerance: ±5%; Current Rating: 300mA; DC Resistance(DCR): 650mΩ; Q @ Frequency: 12@100MHz; Frequency - Self Resonant: 1.7GHz; Type: High-frequency inductor；Multilayer inductor
L41 L43 L44 L46 L48 L49 = MGGB1608M501HT-LF: Impedance @ Frequency:500Ω@100MHz Tolerance:±25% Tolerance:±25% DC Resistance(DCR):- Current Rating:- Number of Circuits:1 Operating Temperature:- Operating Temperature:-; LCSC Part Name: 单路 0603磁珠 阻抗500Ω@100MHz; Supplier Part: C281149; Manufacturer: microgate(麦捷科技); Supplier Footprint: 0603; JLCPCB Part Class: Extended Part; Datasheet: https://item.szlcsc.com/datasheet/MGGB1608M501HT-LF/267482.html; Supplier: LCSC; Impedance @ Frequency: 500Ω@100MHz; Tolerance: ±25%; Number of Circuits: 1
R119 R120 = AC0603FR-0733RL: Type:Thick Film Resistors Resistance: Tolerance:±1% Tolerance:±1% Power(Watts): Overload Voltage (Max): Temperature Coefficient:±100ppm/℃ Temperature Coefficient:±100ppm/℃ Operating Temperature Range:-55℃~+155℃ Operating Temperature Range:-55℃~+155℃; LCSC Part Name: 厚膜电阻 33Ω ±1% 100mW; Supplier Part: C144667; Manufacturer: YAGEO(国巨); Supplier Footprint: 0603; JLCPCB Part Class: Extended Part; Datasheet: https://atta.szlcsc.com/upload/public/pdf/source/20180927/C229861_4ABDC471507C1ED6AFB4BA66AFC8620A.pdf; Supplier: LCSC; Type: Thick Film Resistors; Tolerance: ±1%; Temperature Coefficient: ±100ppm/℃; Operating Temperature Range: -55℃~+155℃
U31 = GP-02_C503596: GNSS Type:BDS；GPS Interface:UART Voltage - Supply:2.7V~3.6V Voltage - Supply:2.7V~3.6V Current - Supply:25mA@3.3V Time To First Fix:32s Operating Temperature:-40℃~+85℃ Operating Temperature:-40℃~+85℃ Features:Hot start acceleration；Short-circuit detection; LCSC Part Name: GPS模块; Supplier Part: C503596; Manufacturer: Ai-Thinker(安信可); Supplier Footprint: 10.1x9.7x2.4mm; JLCPCB Part Class: Extended Part; Datasheet: https://item.szlcsc.com/datasheet/GP-02/516243.html; Supplier: LCSC; GNSS Type: BDS；GPS; Interface: UART; Voltage - Supply: 2.7V~3.6V; Current - Supply: 25mA@3.3V; Time To First Fix: 32s; Operating Temperature: -40℃~+85℃; Features: Hot start acceleration；Short-circuit detection
C162 = 0603B562K500NT: Capacitance:5.6nF Tolerance:±10% Tolerance:±10% Voltage Rating:50V Temperature Coefficient:X7R; LCSC Part Name: 5.6nF ±10% 50V; Supplier Part: C1628; Manufacturer: FH(风华); Supplier Footprint: 0603; JLCPCB Part Class: Extended Part; Datasheet: https://item.szlcsc.com/datasheet/0603B562K500NT/1980.html; Supplier: LCSC; Tolerance: ±10%; Voltage Rating: 50V; Temperature Coefficient: X7R
C166 C183 = CL10A476MQ8QRNC: Capacitance:47uF Tolerance:±20% Tolerance:±20% Voltage Rating:6.3V Temperature Coefficient:X5R; LCSC Part Name: 47uF ±20% 6.3V; Supplier Part: C730416; Manufacturer: SAMSUNG(三星); Supplier Footprint: 0603; JLCPCB Part Class: Extended Part; Datasheet: https://item.szlcsc.com/datasheet/CL10A476MQ8QRNC/778815.html; Supplier: LCSC; Tolerance: ±20%; Voltage Rating: 6.3V; Temperature Coefficient: X5R
C169 C170 C174 C179 = CL10A226MO7JZNC: Capacitance:22uF Tolerance:±20% Tolerance:±20% Voltage Rating:16V Temperature Coefficient:X5R; LCSC Part Name: 22uF ±20% 16V; Supplier Part: C2762594; Manufacturer: SAMSUNG(三星); Supplier Footprint: 0603; JLCPCB Part Class: Extended Part; Datasheet: https://item.szlcsc.com/datasheet/CL10A226MO7JZNC/2889856.html; Supplier: LCSC; Tolerance: ±20%; Voltage Rating: 16V; Temperature Coefficient: X5R
C171 C172 C180 C181 = CL10A105KA8NNNC: Capacitance:1uF Tolerance:±10% Tolerance:±10% Voltage Rating:25V Temperature Coefficient:X5R; LCSC Part Name: 1uF ±10% 25V; Supplier Part: C5673; Manufacturer: SAMSUNG(三星); Supplier Footprint: 0603; JLCPCB Part Class: Extended Part; Datasheet: https://item.szlcsc.com/datasheet/CL10A105KA8NNNC/6132.html; Supplier: LCSC; Tolerance: ±10%; Voltage Rating: 25V; Temperature Coefficient: X5R
D2 = BAT54C_C53373700: Diode Configuration:- Voltage - Forward(Vf@If):1V@100mA Voltage - DC Reverse(Vr):30V Current - Rectified:200mA Reverse Leakage Current (Ir):2uA@25V Operating Junction Temperature Range:- Operating Junction Temperature Range:- Non-Repetitive Peak Forward S; LCSC Part Name: BAT54C 肖特基二极管 电压:30V 电流:200mA; Supplier Part: C53373700; Manufacturer: CCX(晁禾); Supplier Footprint: SOT-23; JLCPCB Part Class: Extended Part; Datasheet: https://item.szlcsc.com/datasheet/BAT54C/56489392.html; Supplier: LCSC; Voltage - Forward(Vf@If): 1V@100mA; Voltage - DC Reverse(Vr): 30V; Current - Rectified: 200mA; Reverse Leakage Current (Ir): 2uA@25V; Non-Repetitive Peak Forward Surge Current: 600mA
D3 = SS34_C52023881: Diode Configuration:1 Independent Voltage - Forward(Vf@If):550mV@3A Voltage - DC Reverse(Vr):40V Current - Rectified:3A Reverse Leakage Current (Ir):500uA@40V Operating Junction Temperature Range:-55℃~+125℃ Operating Junction Temperature Range:-55℃~+125℃; LCSC Part Name: 表面贴装肖特基势垒整流器，金属硅结，低功耗、高效率，内置应变消除，适用于自动化贴装，正向浪涌电流能力高; Supplier Part: C52023881; Manufacturer: Hangyu(航昱微); Supplier Footprint: SMA; JLCPCB Part Class: Extended Part; Datasheet: https://item.szlcsc.com/datasheet/SS34/54772671.html; Supplier: LCSC; Diode Configuration: 1 Independent; Voltage - Forward(Vf@If): 550mV@3A; Voltage - DC Reverse(Vr): 40V; Current - Rectified: 3A; Reverse Leakage Current (Ir): 500uA@40V; Operating Junction Temperature Range: -55℃~+125℃; Non-Repetitive Peak Forward Surge Current: 80A
L42 = MCS0530-4R7MN2: Inductance:4.7uH Tolerance:±20% Tolerance:±20% Current Rating:3.5A Current - Saturation (Isat):5A DC Resistance(DCR):50mΩ Q @ Frequency:- Frequency - Self Resonant:- Ratings:-; LCSC Part Name: 4.7uH ±20% 5A; Supplier Part: C2836880; Manufacturer: PSA(信昌电陶); Supplier Footprint: SMD,5.4x5.2mm; JLCPCB Part Class: Extended Part; Datasheet: https://item.szlcsc.com/datasheet/MCS0530-4R7MN2/3005154.html; Supplier: LCSC; Tolerance: ±20%; Current Rating: 3.5A; Current - Saturation (Isat): 5A; DC Resistance(DCR): 50mΩ
L45 = SRN4030HA-100M: Inductance: Tolerance:±20% Tolerance:±20% Current Rating: Current - Saturation(Isat):2.2A DC Resistance(DCR): Ratings:AEC-Q200; LCSC Part Name: 10uH ±20% 2.2A; Supplier Part: C6235064; Manufacturer: BOURNS; Supplier Footprint: SMD,4x4mm; JLCPCB Part Class: Extended Part; Datasheet: https://atta.szlcsc.com/upload/public/pdf/source/20240417/61014F1586F5A90D5900B220AD898FB0.pdf; Supplier: LCSC; Tolerance: ±20%; Current - Saturation(Isat): 2.2A; Ratings: AEC-Q200
Q7 = BSS123_C54426039: Number:1 N-channel Drain to Source Voltage:100V Current - Continuous Drain(Id):170mA RDS(on):6Ω@10V Pd - Power Dissipation:360mW Gate Threshold Voltage (Vgs(th)):2.8V Gate Charge(Qg):2.5nC Input Capacitance(Ciss):73pF Reverse Transfer Capacitance (Crss@Vd; LCSC Part Name: SOT-23封装塑料封装MOSFET，N沟道，具备ESD保护; Supplier Part: C54426039; Manufacturer: luJing(鲁晶); Supplier Footprint: SOT-23; JLCPCB Part Class: Extended Part; Datasheet: https://item.szlcsc.com/datasheet/BSS123/57750633.html; Supplier: LCSC; Number: 1 N-channel; Drain to Source Voltage: 100V; Current - Continuous Drain(Id): 170mA; RDS(on): 6Ω@10V; Pd - Power Dissipation: 360mW; Gate Threshold Voltage (Vgs(th)): 2.8V; Gate Charge(Qg): 2.5nC; Input Capacitance(Ciss): 73pF; Reverse Transfer Capacitance (Crss@Vds): 3.4pF; Type: N-Channel; Output Capacitance(Coss): 7pF; Vgs: ±20V
R122 = CRG0603J10K: Type:Thick Film Resistor Resistance:10kΩ Tolerance:±5% Tolerance:±5% Power(Watts):100mW Voltage-Supply(Max):75V Temperature Coefficient:±200ppm/℃ Temperature Coefficient:±200ppm/℃ Operating Temperature:-55℃~+155℃ Operating Temperature:-55℃~+155℃; LCSC Part Name: 厚膜电阻 10kΩ ±5% 100mW; Supplier Part: C2073745; Manufacturer: TE Connectivity(泰科电子); Supplier Footprint: 0603; JLCPCB Part Class: Extended Part; Datasheet: https://item.szlcsc.com/datasheet/CRG0603J10K/2165331.html; Supplier: LCSC; Type: Thick Film Resistor; Tolerance: ±5%; Power(Watts): 100mW; Voltage-Supply(Max): 75V; Temperature Coefficient: ±200ppm/℃; Operating Temperature: -55℃~+155℃
R124 = RC0603FR-0775KL: Type:Thick Film Resistor Resistance:75kΩ Tolerance:±1% Tolerance:±1% Power(Watts):100mW Voltage-Supply(Max):75V Temperature Coefficient:±100ppm/℃ Temperature Coefficient:±100ppm/℃ Operating Temperature:-55℃~+155℃ Operating Temperature:-55℃~+155℃; LCSC Part Name: 厚膜电阻 75kΩ ±1% 100mW; Supplier Part: C114636; Manufacturer: YAGEO(国巨); Supplier Footprint: 0603; JLCPCB Part Class: Extended Part; Datasheet: https://item.szlcsc.com/datasheet/RC0603FR-0775KL/115880.html; Supplier: LCSC; Type: Thick Film Resistor; Tolerance: ±1%; Power(Watts): 100mW; Voltage-Supply(Max): 75V; Temperature Coefficient: ±100ppm/℃; Operating Temperature: -55℃~+155℃
R125 = RC0603FR-078K2L: Type:Thick Film Resistors Resistance: Tolerance:±1% Tolerance:±1% Power(Watts): Overload Voltage (Max): Temperature Coefficient:±100ppm/℃ Temperature Coefficient:±100ppm/℃ Operating Temperature Range:-55℃~+155℃ Operating Temperature Range:-55℃~+155℃; LCSC Part Name: 厚膜电阻 8.2kΩ ±1% 100mW; Supplier Part: C114637; Manufacturer: YAGEO(国巨); Supplier Footprint: 0603; JLCPCB Part Class: Extended Part; Datasheet: https://atta.szlcsc.com/upload/public/pdf/source/20180821/C275644_0D56F95EFF785E7D9A1FEF436B37DA78.pdf; Supplier: LCSC; Type: Thick Film Resistors; Tolerance: ±1%; Temperature Coefficient: ±100ppm/℃; Operating Temperature Range: -55℃~+155℃
R126 = ARG03DTC6402N: Type:Thin Film Resistor Resistance:64kΩ Tolerance:±0.5% Tolerance:±0.5% Power(Watts):100mW Voltage-Supply(Max):75V Temperature Coefficient:±25ppm/℃ Temperature Coefficient:±25ppm/℃ Operating Temperature:-55℃~+155℃ Operating Temperature:-55℃~+155℃; LCSC Part Name: 薄膜电阻 64kΩ ±0.5% 100mW 停产; Supplier Part: C2902643; Manufacturer: Viking(光颉); Supplier Footprint: 0603; JLCPCB Part Class: Extended Part; Datasheet: https://item.szlcsc.com/datasheet/ARG03DTC6402N/3155833.html; Supplier: LCSC; Type: Thin Film Resistor; Tolerance: ±0.5%; Power(Watts): 100mW; Voltage-Supply(Max): 75V; Temperature Coefficient: ±25ppm/℃; Operating Temperature: -55℃~+155℃
R127 = RC0603FR-076K8L: Type:Thick Film Resistor Resistance:6.8kΩ Tolerance:±1% Tolerance:±1% Power(Watts):100mW Voltage-Supply(Max):75V Temperature Coefficient:±100ppm/℃ Temperature Coefficient:±100ppm/℃ Operating Temperature:-55℃~+155℃ Operating Temperature:-55℃~+155℃; LCSC Part Name: 厚膜电阻 6.8kΩ ±1% 100mW; Supplier Part: C114632; Manufacturer: YAGEO(国巨); Supplier Footprint: 0603; JLCPCB Part Class: Extended Part; Datasheet: https://item.szlcsc.com/datasheet/RC0603FR-076K8L/115876.html; Supplier: LCSC; Type: Thick Film Resistor; Tolerance: ±1%; Power(Watts): 100mW; Voltage-Supply(Max): 75V; Temperature Coefficient: ±100ppm/℃; Operating Temperature: -55℃~+155℃
R128 = RC0603FR-0730KL: Type:Thick Film Resistor Resistance:30kΩ Tolerance:±1% Tolerance:±1% Power(Watts):100mW Voltage-Supply(Max):75V Temperature Coefficient:±100ppm/℃ Temperature Coefficient:±100ppm/℃ Operating Temperature:-55℃~+155℃ Operating Temperature:-55℃~+155℃; LCSC Part Name: 厚膜电阻 30kΩ ±1% 100mW; Supplier Part: C100001; Manufacturer: YAGEO(国巨); Supplier Footprint: 0603; JLCPCB Part Class: Extended Part; Datasheet: https://item.szlcsc.com/datasheet/RC0603FR-0730KL/101215.html; Supplier: LCSC; Type: Thick Film Resistor; Tolerance: ±1%; Power(Watts): 100mW; Voltage-Supply(Max): 75V; Temperature Coefficient: ±100ppm/℃; Operating Temperature: -55℃~+155℃
U32 = MP1584EN-LF-Z-JSM: Function:Step-down type Voltage - Supply:4.5V~40V Voltage - Supply:4.5V~40V Output Voltage:800mV~37V Output Voltage:800mV~37V Output Current:3A Frequency - Switching:100kHz~220kHz Frequency - Switching:100kHz~220kHz Operating Temperature:-40℃~+125℃ Operat; LCSC Part Name: 异步降压转换器，采用电流模式控制，具备多种保护功能; Supplier Part: C49367328; Manufacturer: JSMSEMI(杰盛微); Supplier Footprint: ESOP-8; JLCPCB Part Class: Extended Part; Datasheet: https://item.szlcsc.com/datasheet/MP1584EN-LF-Z-JSM/51875040.html; Supplier: LCSC; Function: Step-down type; Voltage - Supply: 4.5V~40V; Output Voltage: 800mV~37V; Output Current: 3A; Frequency - Switching: 100kHz~220kHz; Operating Temperature: -40℃~+125℃; Synchronous Rectifier: No; Number of Outputs: 1; Topology: Buck; Quiescent Current: 65uA; Switch tube (built-in/external): Built-in; Output Type: Adjustable; Features: Light load efficient mode；External compensation；Cycle-by-cycle current limiting；Overcurrent Protection；Hiccup current limiting；Protection latch
U33 U34 = GRM188C61E226ME01D: Capacitance:22uF Tolerance:±20% Tolerance:±20% Voltage Rating:25V; LCSC Part Name: 22uF ±20% 25V; Supplier Part: C29519229; Manufacturer: muRata(村田); Supplier Footprint: 0603; JLCPCB Part Class: Extended Part; Datasheet: https://item.szlcsc.com/datasheet/GRM188C61E226ME01D/31245821.html; Supplier: LCSC; Tolerance: ±20%; Voltage Rating: 25V
U35 U40 = LDL1117S50R: Output Configuration:Positive Voltage - Supply:18V Output Voltage:5V Output Voltage:5V Output Current:1.2A Power Supply Rejection Ratio (PSRR):87dB@(120Hz) Voltage Dropout:350mV@(1.2A) standby current:250uA Noise:60uVrms Features:Over Current Protection；S; LCSC Part Name: 5V 1.2A 18V; Supplier Part: C970558; Manufacturer: ST(意法半导体); Supplier Footprint: SOT-223; JLCPCB Part Class: Extended Part; Datasheet: https://item.szlcsc.com/datasheet/LDL1117S50R/1060020.html; Supplier: LCSC; Output Configuration: Positive; Voltage - Supply: 18V; Output Voltage: 5V; Output Current: 1.2A; Power Supply Rejection Ratio (PSRR): 87dB@(120Hz); Voltage Dropout: 350mV@(1.2A); standby current: 250uA; Noise: 60uVrms; Features: Over Current Protection；Short Circuit Protection；Thermal shutdown; Operating Temperature: -40℃~+125℃; Output Type: Fixed; Number of Outputs: 1
U36 = AP63203WU-7: Function:Step-down type Voltage - Supply:3.8V~32V Voltage - Supply:3.8V~32V Output Voltage:3.3V Output Voltage:3.3V Output Current:2A Frequency - Switching:1.1MHz Frequency - Switching:1.1MHz Operating Temperature:-40℃~+85℃@(TA) Operating Temperature:-40℃; LCSC Part Name: 降压型 2A 3.8V~32V; Supplier Part: C780769; Manufacturer: DIODES(美台); Supplier Footprint: TSOT-23-6; JLCPCB Part Class: Extended Part; Datasheet: https://item.szlcsc.com/datasheet/AP63203WU-7/832852.html; Supplier: LCSC; Function: Step-down type; Voltage - Supply: 3.8V~32V; Output Voltage: 3.3V; Output Current: 2A; Frequency - Switching: 1.1MHz; Operating Temperature: -40℃~+85℃@(TA); Synchronous Rectifier: Yes; Number of Outputs: 1; Topology: Buck; Quiescent Current: 22uA; Switch tube (built-in/external): Built-in; Output Type: Fixed; Features: Light load efficient mode；Cycle-by-cycle current limiting；Overcurrent Protection；EMI optimization (spread spectrum)；Hiccup current limiting
U37 U39 = LP5907MFX-3.3: Output Configuration:Positive Voltage - Supply:5.5V Output Voltage:3.3V Output Voltage:3.3V Output Current:300mA Power Supply Rejection Ratio (PSRR):75dB@(1kHz) Voltage Dropout:180mV@(300mA) standby current:2uA Noise:51uVrms Features:Over Current Protecti; LCSC Part Name: 3.3V 300mA 5.5V; Supplier Part: C23380874; Manufacturer: TECH PUBLIC(台舟); Supplier Footprint: SOT-23-5; JLCPCB Part Class: Extended Part; Datasheet: https://item.szlcsc.com/datasheet/LP5907MFX-3.3/25111544.html; Supplier: LCSC; Output Configuration: Positive; Voltage - Supply: 5.5V; Output Voltage: 3.3V; Output Current: 300mA; Power Supply Rejection Ratio (PSRR): 75dB@(1kHz); Voltage Dropout: 180mV@(300mA); standby current: 2uA; Noise: 51uVrms; Features: Over Current Protection；Enable control；Thermal shutdown；Output discharge; Operating Temperature: -40℃~+150℃; Output Type: Fixed; Number of Outputs: 1

## Nets
3V3_CODEC: C181.2 U39.5(VOUT) ; also on sheet 2
3V3_LO: C172.2 U37.5(VOUT) ; also on sheet 3 5
3V3_MCU: C165.1 C168.2 C169.1 L41.1 L45.2 U36.1(FB) ; also on sheet 1 2 7 10
5VA: C170.1 C179.1 C183.2 L46.1 L48.1 U40.2(VOUT) U40.4(VOUT) ; also on sheet 4 5 7 9
8V: C161.2 FPC1.2 FPC1.3 L42.1 L43.2 L49.2 R124.2 U33.2 ; also on sheet 6
GND: BT1.2(-) C143.1 C144.1 C145.1 C154.1 C155.1 C156.1 C157.1 C158.1 C159.1 C161.1 C163.1 C164.1 C166.1 C167.1 C168.1 C169.2 C170.2 C171.1 C172.1 C173.2 C174.2 C175.1 C179.2 C180.1 C181.1 C183.1 C184.1 C185.2 D3.2(A) D4.2(GND) D5.1 FPC1.1 FPC1.4 FPC1.7 FPC1.11 FPC1.17 FPC1.21 FPC1.23 FPC1.26 FPC1.29 FPC1.52 GPS1.2 GPS1.3 H2.4 HAND_MIC.5 KEY.5 PHONE.5 Q7.2(S) R125.1 R126.1 R127.1 R128.1 R129.1 R130.1 RX1.2 RX1.3 TX1.2 TX1.3 U16.2(VSS) U16.3(VIN+) U31.1(GND) U31.10(GND) U31.12(GND) U32.5(GND) U32.9(GND) U33.1 U34.1 U35.1(GND) U36.4(GND) U37.2(GND) U39.2(GND) U40.1(GND) U41.1 U43.2(Cathode) USB1.A1B12(GND) USB1.B1A12(GND) ; also on sheet 1 2 3 4 5 6 7 8 9 10
VBATT: C156.2 U31.6(VBAT) ; also on sheet 1
VDDA: C145.2 U16.5(VDD) ; also on sheet 1
VIN: C164.2 L44.1 R121.2 U32.7(VIN) U34.2 U41.2
1PPS: R120.1 ; also on sheet 1
9555_INT: FPC1.10 ; also on sheet 1
ALC: C143.2 R109.2 ; also on sheet 1
BATT: BT1.1(+) ; also on sheet 1
DAH_KEY: KEY.2 ; also on sheet 1
DIT_KEY: KEY.6 ; also on sheet 1
ENC_CH1: FPC1.12 ; also on sheet 1
ENC_CH2: FPC1.13 ; also on sheet 1
ENC_SW: FPC1.14 ; also on sheet 1
EXT_ALC: D5.2 EXT_PA.6 R107.1
GPS_RX: R119.1 ; also on sheet 1
I2C2_SCL: FPC1.8 ; also on sheet 1
I2C2_SDA: FPC1.9 ; also on sheet 1
LCD_BL: FPC1.18 ; also on sheet 1
LCD_CS: FPC1.20 ; also on sheet 1
LCD_D0: FPC1.27 ; also on sheet 1
LCD_D1: FPC1.28 ; also on sheet 1
LCD_D2: FPC1.30 ; also on sheet 1
LCD_D3: FPC1.31 ; also on sheet 1
LCD_D4: FPC1.33 ; also on sheet 1
LCD_D5: FPC1.34 ; also on sheet 1
LCD_D6: FPC1.36 ; also on sheet 1
LCD_D7: FPC1.37 ; also on sheet 1
LCD_D8: FPC1.39 ; also on sheet 1
LCD_D9: FPC1.40 ; also on sheet 1
LCD_D10: FPC1.42 ; also on sheet 1
LCD_D11: FPC1.43 ; also on sheet 1
LCD_D12: FPC1.45 ; also on sheet 1
LCD_D13: FPC1.46 ; also on sheet 1
LCD_D14: FPC1.48 ; also on sheet 1
LCD_D15: FPC1.49 ; also on sheet 1
LCD_RD: FPC1.24 ; also on sheet 1
LCD_RS/DC: FPC1.25 ; also on sheet 1
LCD_RST: FPC1.19 ; also on sheet 1
LCD_WR: FPC1.22 ; also on sheet 1
MCU_VDD: H2.1 ; also on sheet 1
MIC_IN: HAND_MIC.2 ; also on sheet 2
on/off: R122.2
ON/OFF_SW: D2.3(C) FPC1.15
OUT_TX: TX1.1 ; also on sheet 6
PTT: HAND_MIC.3 ; also on sheet 1
PW_BT: D2.2(A) ; also on sheet 1
PW_HOLD: Q7.1(G) R128.2 ; also on sheet 1
R_OUT: PHONE.3 PHONE.6 ; also on sheet 2
RX_ANT: RX1.1 ; also on sheet 10
SPK: HAND_MIC.7
SPK1: H3.2 ; also on sheet 2
SPK2: H3.1 ; also on sheet 2
SPK_HP: HAND_MIC.6
SPK_SD: PHONE.2 ; also on sheet 1 2
SPK_VCC: C166.2 U35.2(VOUT) U35.4(VOUT) ; also on sheet 2
SWDCLK: H2.3 ; also on sheet 1
SWDIO: H2.2 ; also on sheet 1
T/R_SW: FPC1.16 R131.1 ; also on sheet 1 4 5 6
USB_N: D4.3(IO2) ; also on sheet 1
USB_P: D4.1(IO1) ; also on sheet 1
$13N5: C157.2 C158.2 C159.2 L41.2 U31.8(P3.3V)
$13N10: GPS1.1 L40.2 U31.11(ANT)
$13N15: C154.2 C155.2 L40.1 U31.14(VCC_RF)
$13N16: R119.2 U31.2(TXD1)
$13N17: R120.2 U31.4(1PPS)
$14N1: C174.1 C175.2 L44.2 U36.2(EN) U36.3(VIN)
$14N3: C165.2 U36.6(BST)
$14N4: L45.1 U36.5(SW)
$14N11: C160.1 D3.1(C) L42.2 U32.1(SW)
$14N12: C162.2 C163.2 U32.3(COMP)
$14N13: R124.1 R125.2 U32.4(FB)
$14N15: C162.1 R127.2
$14N17: R126.2 U32.6(RT)
$14N19: C160.2 U32.8(BST)
$14N23: R121.1 U32.2(EN)
$14N42: C184.2 C185.1 L49.1 U40.3(VIN)
$14N49: C180.2 L48.2 U39.1(VIN) U39.3(EN)
$14N52: C171.2 L46.2 U37.1(VIN) U37.3(EN)
$14N79: C167.2 C173.1 L43.1 U35.3(VIN)
$14N92: D2.1(A) Q7.3(D) R122.1
$15N1: USB1.1(SHELL) USB1.2(SHELL) USB1.3(SHELL) USB1.4(SHELL)
$15N3: D4.5(VBUS) USB1.A4B9(VBUS) USB1.B4A9(VBUS)
$15N4: D4.6(IO1) USB1.A6(DP1) USB1.B6(DP2)
$15N5: D4.4(IO2) USB1.A7(DN1) USB1.B7(DN2)
$15N11: R129.2 USB1.A5(CC1)
$15N12: R130.2 USB1.B5(CC2)
$15N52: EXT_PA.2 U43.4(Collector)
$15N53: EXT_PA.5 U43.3(Emitter)
$15N56: R131.2 U43.1(Anode)
$15N147: FPC1.32 FPC1.35 FPC1.38 FPC1.41 FPC1.44 FPC1.47 FPC1.50 FPC1.51
$16N1: C61.1 R106.2 R108.1 U16.4(VIN-)
$16N2: C61.2 R108.2 R109.1 U16.1(VOUT)
$16N3: C144.2 R106.1 R107.2

Not connected (* = marked no-connect by the designer): EXT_PA 3 4 7; FPC1 5 6; HAND_MIC 4; KEY 3 4 7; PHONE 4 7; U31 3(RXD1)* 5(ON/OFF)* 7(NC1)* 9(NRST)* 13(NC2)* 15(TMS)* 16(SDA)* 17(SCL)* 18(TCK)*; U37 4(NC); U39 4(NC); USB1 A8(SBU1)* B8(SBU2)*
